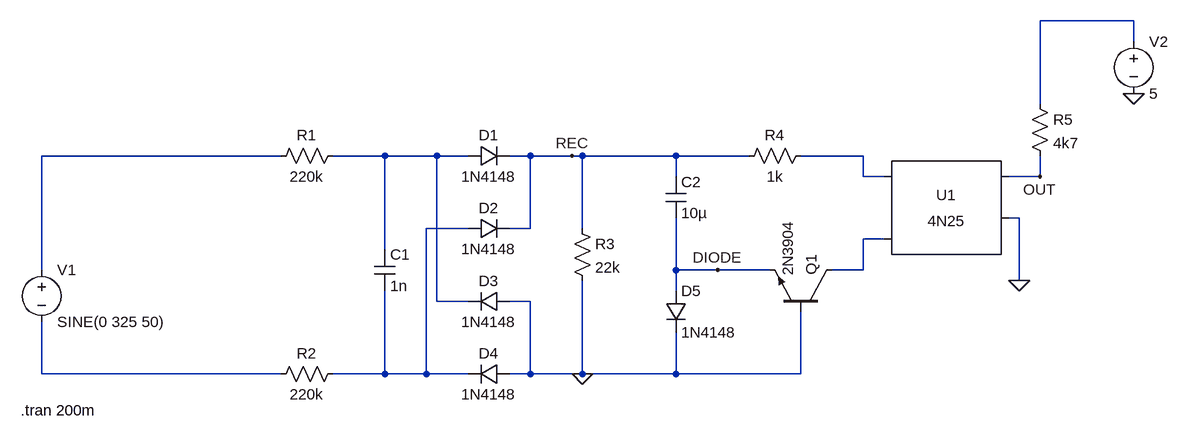
[diagram p0: schematic mains_zero_crossing_detector.asc]
mains_zero_crossing_detector.asc, the LTspice schematic file:
Version 4.1
SHEET 1 1720 680
WIRE 1664 -256 1520 -256
WIRE 1664 -224 1664 -256
WIRE 1520 -128 1520 -256
WIRE 352 -48 -16 -48
WIRE 512 -48 432 -48
WIRE 592 -48 512 -48
WIRE 640 -48 592 -48
WIRE 736 -48 704 -48
WIRE 800 -48 736 -48
WIRE 816 -48 800 -48
WIRE 960 -48 816 -48
WIRE 1072 -48 960 -48
WIRE 1248 -48 1152 -48
WIRE 960 -16 960 -48
WIRE 1248 -16 1248 -48
WIRE 1280 -16 1248 -16
WIRE 1520 -16 1520 -48
WIRE 1520 -16 1472 -16
WIRE 1488 48 1472 48
WIRE 640 64 576 64
WIRE 736 64 736 -48
WIRE 736 64 704 64
WIRE 816 64 816 -48
WIRE 1280 80 1248 80
WIRE 512 96 512 -48
WIRE -16 128 -16 -48
WIRE 960 128 960 48
WIRE 1024 128 960 128
WIRE 1104 128 1024 128
WIRE 1248 128 1248 80
WIRE 1248 128 1200 128
WIRE 1488 144 1488 48
WIRE 960 160 960 128
WIRE 592 176 592 -48
WIRE 640 176 592 176
WIRE 736 176 704 176
WIRE -16 288 -16 208
WIRE 352 288 -16 288
WIRE 512 288 512 160
WIRE 512 288 432 288
WIRE 576 288 576 64
WIRE 576 288 512 288
WIRE 640 288 576 288
WIRE 736 288 736 176
WIRE 736 288 704 288
WIRE 816 288 816 144
WIRE 816 288 736 288
WIRE 960 288 960 224
WIRE 960 288 816 288
WIRE 1152 288 1152 192
WIRE 1152 288 960 288
FLAG 816 288 0
FLAG 1488 144 0
FLAG 1664 -144 0
FLAG 1520 -16 OUT
FLAG 1024 128 DIODE
FLAG 800 -48 REC
SYMBOL voltage -16 112 R0
WINDOW 123 0 0 Left 0
WINDOW 39 0 0 Left 0
SYMATTR InstName V1
SYMATTR Value SINE(0 325 50)
SYMBOL res 448 -64 R90
WINDOW 0 0 56 VBottom 2
WINDOW 3 32 56 VTop 2
SYMATTR InstName R1
SYMATTR Value 220k
SYMBOL res 448 272 R90
WINDOW 0 0 56 VBottom 2
WINDOW 3 32 56 VTop 2
SYMATTR InstName R2
SYMATTR Value 220k
SYMBOL cap 496 96 R0
SYMATTR InstName C1
SYMATTR Value 1n
SYMBOL diode 640 -32 R270
WINDOW 0 32 32 VTop 2
WINDOW 3 0 32 VBottom 2
SYMATTR InstName D1
SYMATTR Value 1N4148
SYMBOL diode 640 80 R270
WINDOW 0 32 32 VTop 2
WINDOW 3 0 32 VBottom 2
SYMATTR InstName D2
SYMATTR Value 1N4148
SYMBOL diode 704 160 R90
WINDOW 0 0 32 VBottom 2
WINDOW 3 32 32 VTop 2
SYMATTR InstName D3
SYMATTR Value 1N4148
SYMBOL diode 704 272 R90
WINDOW 0 0 32 VBottom 2
WINDOW 3 32 32 VTop 2
SYMATTR InstName D4
SYMATTR Value 1N4148
SYMBOL res 800 48 R0
SYMATTR InstName R3
SYMATTR Value 22k
SYMBOL cap 944 -16 R0
SYMATTR InstName C2
SYMATTR Value 10µ
SYMATTR SpiceLine V=10
SYMBOL diode 944 160 R0
SYMATTR InstName D5
SYMATTR Value 1N4148
SYMBOL npn 1200 192 M270
SYMATTR InstName Q1
SYMATTR Value 2N3904
SYMBOL Optos\\4N25 1376 48 R0
SYMATTR InstName U1
SYMBOL res 1168 -64 R90
WINDOW 0 0 56 VBottom 2
WINDOW 3 32 56 VTop 2
SYMATTR InstName R4
SYMATTR Value 1k
SYMBOL res 1504 -144 R0
SYMATTR InstName R5
SYMATTR Value 4k7
SYMBOL voltage 1664 -240 R0
WINDOW 123 0 0 Left 0
WINDOW 39 0 0 Left 0
SYMATTR InstName V2
SYMATTR Value 5
TEXT -48 344 Left 2 !.tran 200m

The netlist it stands for:
* mains_zero_crossing_detector.asc
V1 N002 N007 SINE(0 325 50)
R1 N003 N002 220k
R2 N005 N007 220k
C1 N003 N005 1n
D1 N003 REC 1N4148
D2 N005 REC 1N4148
D3 0 N003 1N4148
D4 0 N005 1N4148
R3 REC 0 22k
C2 REC DIODE 10µ V=10
D5 DIODE 0 1N4148
Q1 N006 0 DIODE 0 2N3904
X§U1 N004 N006 OUT 0 NC_01 4N25
R4 N004 REC 1k
R5 N001 OUT 4k7
V2 N001 0 5
.model D D
.lib standard.dio
.model NPN NPN
.model PNP PNP
.lib standard.bjt
.tran 200m
.lib 4N25.sub
.backanno
.end